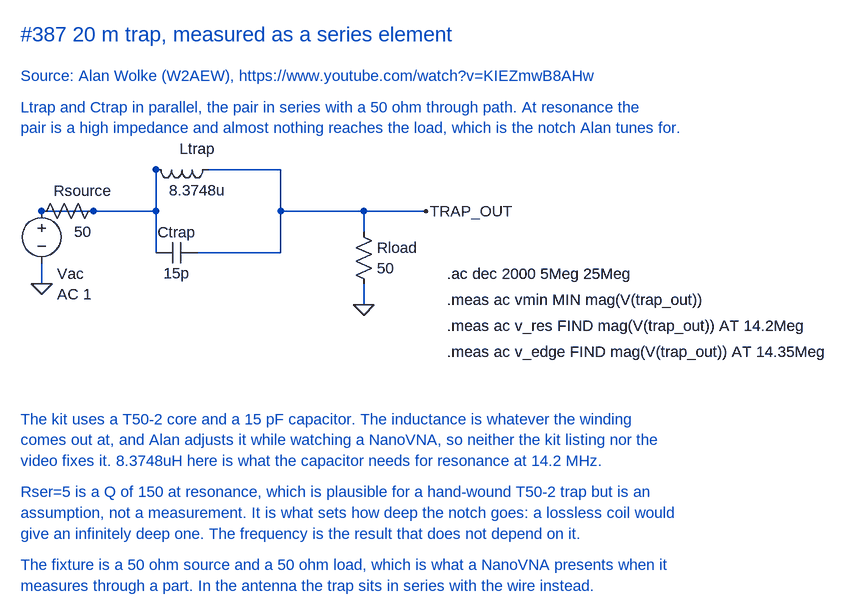
[diagram p0: schematic 20m trap.asc]
20m trap.asc, the LTspice schematic file:
Version 4
SHEET 1 1100 700
WIRE 176 304 256 304
WIRE 176 384 176 416
WIRE 256 304 352 304
WIRE 352 304 352 240
WIRE 352 240 352 240
WIRE 432 240 544 240
WIRE 544 240 544 304
WIRE 352 304 352 368
WIRE 416 368 544 368
WIRE 544 368 544 304
WIRE 544 304 672 304
WIRE 672 304 672 336
WIRE 672 304 768 304
WIRE 672 416 672 448
FLAG 176 416 0
FLAG 672 448 0
FLAG 768 304 TRAP_OUT
SYMBOL voltage 176 288 R0
WINDOW 0 24 112 Left 2
WINDOW 3 24 144 Left 2
SYMATTR InstName Vac
SYMATTR Value AC 1
SYMBOL res 272 288 R90
WINDOW 0 0 32 VBottom 2
WINDOW 3 32 32 VTop 2
SYMATTR InstName Rsource
SYMATTR Value 50
SYMBOL ind 448 224 R90
WINDOW 0 0 32 VBottom 2
WINDOW 3 32 32 VTop 2
SYMATTR InstName Ltrap
SYMATTR Value 8.3748u
SYMATTR SpiceLine Rser=5
SYMBOL cap 416 352 R90
WINDOW 0 0 32 VBottom 2
WINDOW 3 32 32 VTop 2
SYMATTR InstName Ctrap
SYMATTR Value 15p
SYMBOL res 656 320 R0
WINDOW 0 36 40 Left 2
WINDOW 3 36 72 Left 2
SYMATTR InstName Rload
SYMATTR Value 50
TEXT 144 32 Left 3 ;#387 20 m trap, measured as a series element
TEXT 144 96 Left 2 ;Source: Alan Wolke (W2AEW), https://www.youtube.com/watch?v=KIEZmwB8AHw
TEXT 144 144 Left 2 ;Ltrap and Ctrap in parallel, the pair in series with a 50 ohm through path. At resonance the
TEXT 144 176 Left 2 ;pair is a high impedance and almost nothing reaches the load, which is the notch Alan tunes for.
TEXT 144 624 Left 2 ;The kit uses a T50-2 core and a 15 pF capacitor. The inductance is whatever the winding
TEXT 144 656 Left 2 ;comes out at, and Alan adjusts it while watching a NanoVNA, so neither the kit listing nor the
TEXT 144 688 Left 2 ;video fixes it. 8.3748uH here is what the capacitor needs for resonance at 14.2 MHz.
TEXT 144 736 Left 2 ;Rser=5 is a Q of 150 at resonance, which is plausible for a hand-wound T50-2 trap but is an
TEXT 144 768 Left 2 ;assumption, not a measurement. It is what sets how deep the notch goes: a lossless coil would
TEXT 144 800 Left 2 ;give an infinitely deep one. The frequency is the result that does not depend on it.
TEXT 144 848 Left 2 ;The fixture is a 50 ohm source and a 50 ohm load, which is what a NanoVNA presents when it
TEXT 144 880 Left 2 ;measures through a part. In the antenna the trap sits in series with the wire instead.
TEXT 800 400 Left 2 !.ac dec 2000 5Meg 25Meg
TEXT 800 440 Left 2 !.meas ac vmin MIN mag(V(trap_out))
TEXT 800 480 Left 2 !.meas ac v_res FIND mag(V(trap_out)) AT 14.2Meg
TEXT 800 520 Left 2 !.meas ac v_edge FIND mag(V(trap_out)) AT 14.35Meg

The netlist it stands for:
* 20m trap.asc
Vac N001 0 AC 1
Rsource N001 N001 50
Ltrap TRAP_OUT N001 8.3748u Rser=5
Ctrap TRAP_OUT N001 15p
Rload TRAP_OUT 0 50
* #387 20 m trap, measured as a series element
* Source: Alan Wolke (W2AEW), https://www.youtube.com/watch?v=KIEZmwB8AHw
* Ltrap and Ctrap in parallel, the pair in series with a 50 ohm through path. At resonance the
* pair is a high impedance and almost nothing reaches the load, which is the notch Alan tunes for.
* The kit uses a T50-2 core and a 15 pF capacitor. The inductance is whatever the winding
* comes out at, and Alan adjusts it while watching a NanoVNA, so neither the kit listing nor the
* video fixes it. 8.3748uH here is what the capacitor needs for resonance at 14.2 MHz.
* Rser=5 is a Q of 150 at resonance, which is plausible for a hand-wound T50-2 trap but is an
* assumption, not a measurement. It is what sets how deep the notch goes: a lossless coil would
* give an infinitely deep one. The frequency is the result that does not depend on it.
* The fixture is a 50 ohm source and a 50 ohm load, which is what a NanoVNA presents when it
* measures through a part. In the antenna the trap sits in series with the wire instead.
.ac dec 2000 5Meg 25Meg
.meas ac vmin MIN mag(V(trap_out))
.meas ac v_res FIND mag(V(trap_out)) AT 14.2Meg
.meas ac v_edge FIND mag(V(trap_out)) AT 14.35Meg
.backanno
.end